# Altium schematic sheet Clock.SchDoc
size A4; SheetNumber: 10; SheetTotal: 11
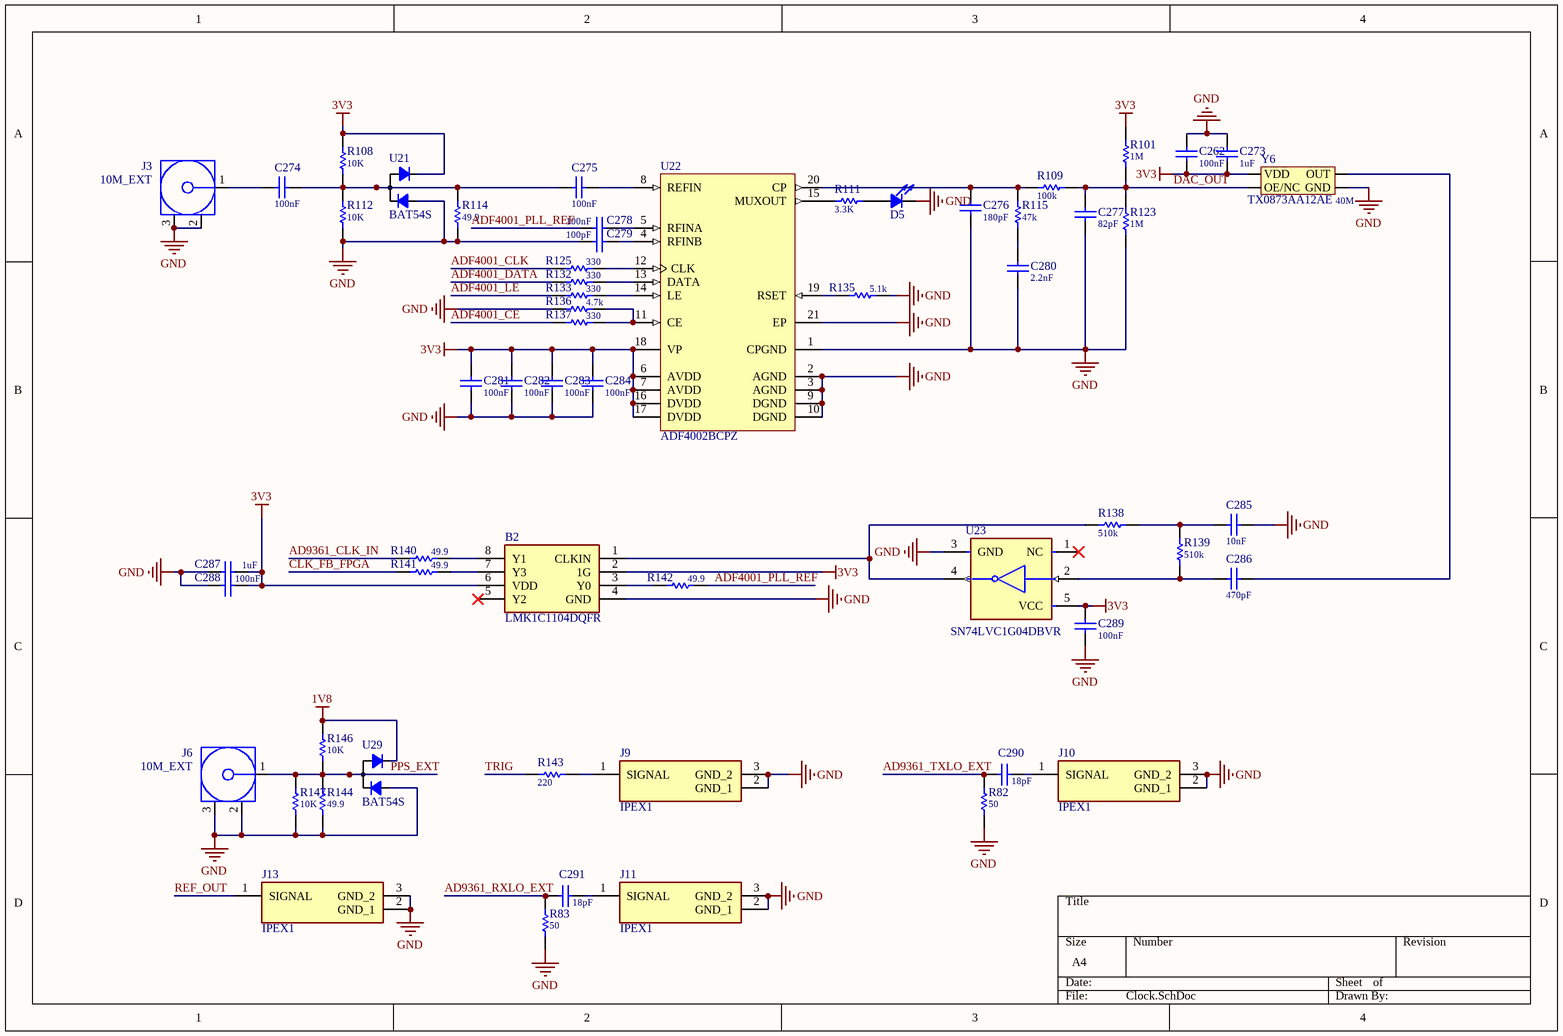
[diagram p0: Clock.SchDoc]

## Parts
B2  LMK1C1104DQFR  [SON50P200X200X80-8N]
C262  value 100nF  [C0402-L]  (hidden comment: Cap-S)
C273  value 1uF  [C0402-L]  (hidden comment: Cap-S)
C274  value 100nF  [C0402-L]  (hidden comment: Cap-S)
C275  value 100nF  [C0402-L]  (hidden comment: Cap-S)
C276  value 180pF  [C0402-L]  (hidden comment: Cap-S)
C277  value 82pF  [C0402-L]  (hidden comment: Cap-S)
C278  value 100nF  [C0402-L]  (hidden comment: Cap-S)
C279  value 100pF  [C0402-L]  (hidden comment: Cap-S)
C280  value 2.2nF  [C0402-L]  (hidden comment: Cap-S)
C281  value 100nF  [C0402-L]  (hidden comment: Cap-S)
C282  value 100nF  [C0402-L]  (hidden comment: Cap-S)
C283  value 100nF  [C0402-L]  (hidden comment: Cap-S)
C284  value 100nF  [C0402-L]  (hidden comment: Cap-S)
C285  value 10nF  [C0402-L]  (hidden comment: Cap-S)
C286  value 470pF  [C0402-L]  (hidden comment: Cap-S)
C287  value 1uF  [C0402-L]  (hidden comment: Cap-S)
C288  value 100nF  [C0402-L]  (hidden comment: Cap-S)
C289  value 100nF  [C0402-L]  (hidden comment: Cap-S)
C290  value 18pF  [C0402-L]  (hidden comment: Cap-S)
C291  value 18pF  [C0402-L]  (hidden comment: Cap-S)
D5  LED  [LED_0603_L]  (value not drawn)
J3  10M_EXT  [66012202111305]
J6  10M_EXT  [66012202111305]
J9  IPEX1  [20279-001E]
J10  IPEX1  [20279-001E]
J11  IPEX1  [20279-001E]
J13  IPEX1  [20279-001E]
R82  value 50  [R0402-L]  (hidden comment: R)
R83  value 50  [R0402-L]  (hidden comment: R)
R101  value 1M  [R0402-L]  (hidden comment: R)
R108  value 10K  [R0402-L]  (hidden comment: R)
R109  value 100k  [R0402-L]  (hidden comment: R)
R111  value 3.3K  [R0402-L]  (hidden comment: R)
R112  value 10K  [R0402-L]  (hidden comment: R)
R114  value 49.9  [R0402-L]  (hidden comment: R)
R115  value 47k  [R0402-L]  (hidden comment: R)
R123  value 1M  [R0402-L]  (hidden comment: R)
R125  value 330  [R0402-L]  (hidden comment: R)
R132  value 330  [R0402-L]  (hidden comment: R)
R133  value 330  [R0402-L]  (hidden comment: R)
R135  value 5.1k  [R0402-L]  (hidden comment: R)
R136  value 4.7k  [R0402-L]  (hidden comment: R)
R137  value 330  [R0402-L]  (hidden comment: R)
R138  value 510k  [R0402-L]  (hidden comment: R)
R139  value 510k  [R0402-L]  (hidden comment: R)
R140  value 49.9  [R0402-L]  (hidden comment: R)
R141  value 49.9  [R0402-L]  (hidden comment: R)
R142  value 49.9  [R0402-L]  (hidden comment: R)
R143  value 220  [R0402-L]  (hidden comment: R)
R144  value 49.9  [R0402-L]  (hidden comment: R)
R146  value 10K  [R0402-L]  (hidden comment: R)
R147  value 10K  [R0402-L]  (hidden comment: R)
U21  BAT54S  [SOT-23-3]
U22  ADF4002BCPZ  [ADI-CP-20-1_N]
U23  SN74LVC1G04DBVR  [FP-DBV0005A-IPC_C]
U29  BAT54S  [SOT-23-3]
Y6  TX0873AA12AE  value 40M  [XTAL-2520]

## Nets
1V8: R146.1 U29.3
3V3: B2.2(1G) B2.6(VDD) C262.1 C273.1 C281.2 C282.2 C283.2 C284.2 C287.1 C288.1 C289.1 R101.1 R108.1 U21.3 U22.6(AVDD) U22.7(AVDD) U22.16(DVDD) U22.17(DVDD) U22.18(VP) U23.5(VCC) Y6.4(VDD)
GND: B2.4(GND) C262.2 C273.2 C276.1 C277.1 C279.1 C280.1 C281.1 C282.1 C283.1 C284.1 C285.1 C287.2 C288.2 C289.2 D5.2 J3.2(GND) J3.3(GND) J6.2(GND) J6.3(GND) J9.2(GND_1) J9.3(GND_2) J10.2(GND_1) J10.3(GND_2) J11.2(GND_1) J11.3(GND_2) J13.2(GND_1) J13.3(GND_2) R82.2 R83.2 R112.2 R114.2 R123.2 R135.2 R136.1 R144.1 R147.2 U21.1 U22.1(CPGND) U22.2(AGND) U22.3(AGND) U22.9(DGND) U22.10(DGND) U22.21(EP) U23.3(GND) U29.1 Y6.2(GND)
AD9361_CLK_IN: R140.1
AD9361_RXLO_EXT: C291.2 R83.1
AD9361_TXLO_EXT: C290.2 R82.1
ADF4001_CE: R137.1
ADF4001_CLK: R125.1
ADF4001_DATA: R132.1
ADF4001_LE: R133.1
ADF4001_PLL_REF: C278.1 R142.2
CLK_FB_FPGA: R141.1
DAC_OUT: C277.2 R101.2 R109.1 R123.1 Y6.1(OE/NC)
PPS_EXT: J6.1(Signal) R144.2 R146.2 R147.1 U29.2
REF_OUT: J13.1(SIGNAL)
TRIG: R143.2
NetB2_1: B2.1(CLKIN) R138.2 U23.4(Y)
NetB2_3: B2.3(Y0) R142.1
NetB2_7: B2.7(Y3) R141.2
NetB2_8: B2.8(Y1) R140.2
NetC274_1: C274.1 J3.1(Signal)
NetC274_2: C274.2 C275.1 R108.2 R112.1 R114.1 U21.2
NetC275_2: C275.2 U22.8(REFIN)
NetC276_2: C276.2 R109.2 R115.2 U22.20(CP)
NetC278_2: C278.2 U22.5(RFINA)
NetC279_2: C279.2 U22.4(RFINB)
NetC280_2: C280.2 R115.1
NetC285_2: C285.2 R138.1 R139.1
NetC286_1: C286.1 Y6.3(OUT)
NetC286_2: C286.2 R139.2 U23.2(A)
NetC290_1: C290.1 J10.1(SIGNAL)
NetC291_1: C291.1 J11.1(SIGNAL)
NetD5_1: D5.1 R111.2
NetJ9_1: J9.1(SIGNAL) R143.1
NetR111_1: R111.1 U22.15(MUXOUT)
NetR125_2: R125.2 U22.12(CLK)
NetR132_2: R132.2 U22.13(DATA)
NetR133_2: R133.2 U22.14(LE)
NetR135_1: R135.1 U22.19(RSET)
NetR136_2: R136.2 R137.2 U22.11(CE)

Not connected (* = marked no-connect by the designer): B2 5(Y2)*; U23 1(NC)*

## Library data of the parts
B2 = LMK1C1104DQFR: Clock Buffer 4-channel output LVC MOS 1.8-V buffer; Manufacturer_Name: Texas Instruments; Geometry.Height: 0.8mm; Manufacturer_Part_Number: LMK1C1104DQFR; Mouser Part Number: 595-LMK1C1104DQFR; Mouser Price/Stock: https://www.mouser.co.uk/ProductDetail/Texas-Instruments/LMK1C1104DQFR?qs=QNEnbhJQKvYdwt0bSAj%252Blw%3D%3D; Arrow Part Number: LMK1C1104DQFR; Arrow Price/Stock: https://www.arrow.com/en/products/lmk1c1104dqfr/texas-instruments?utm_currency=USD&region=nac; Datasheet Link: https://www.ti.com/lit/ds/symlink/lmk1c1104.pdf?ts=1625794058723&ref_url=https%253A%252F%252Fwww.ti.com%252Fproduct%252FLMK1C1104
C262 C273-C291 = Cap-S: 贴片瓷片电容
D5 = LED: 发光二极管
J3 J6 = CMP-03913-103227005-2: Rf Coaxial, Mmcx Jack, 50 Ohm, Pcb Rohs Compliant: Yes; Impedance: 50Ω; Insertion Loss (dB): 0.25dB; Insulation Resistance: 1GΩ; Insulation Material: PTFE; Min Operating Temperature: -55°C; Packaging: Tape and Reel; Connector Type: MMCX; Max Operating Temperature: 155°C
J9-J11 J13 = IPEX4
R82 R83 R101 R108 R109 R111 R112 R114 R115 R123 R125 R132 R133 R135-R144 R146 R147 = Res: 贴片电阻
U22 = CMP-0287-00009-1: 200 MHz Clock Generator PLL, CP-20-1, Pb-Free, 490 Tray; Norm Phase Noise (dBc/Hz): -217dBc; Single/Dual: Single; Max REFin (MHz): 104MHz; Max RF Input (MHz): 200MHz; Frequency Range: 10MHz-200MHz; Supply Current: 4.5mA; ComponentLink2Description: Datasheet; PackageDescription: 20-Lead Lead Frame Chip Scale Package [LFCSP_VQ]; ComponentLink3Description: Package Specification; ComponentLink3URL: http://www.analog.com/static/imported-files/packages/PKG_PDF/LFCSP(CP)/CP_20_1.pdf; DatasheetVersion: REV. A; Code_JEDEC: MO-220-VGGD-1; PackageVersion: 012508-B; ComponentLink1Description: Manufacturer URL; ComponentLink1URL: www.analog.com; PackageReference: CP-20-1; ComponentLink2URL: http://www.analog.com/static/imported-files/data_sheets/ADF4001.pdf
U23 = CMP-04903-000078-1: IC INVERTER 1CH 1-INP SOT23-5; Logic Function: Buffer; Number of Bits: 1; Voltage Rating (AC): 250V; Min Supply Voltage: 1.65V; Capacitance: 22nF; Propagation Delay: 3.7ns; Tolerance: 5%; High Level Output Current: -32mA; Turn-On Delay Time: 7.5ns; Voltage Rating (DC): 400V; Output Current: 32mA; Dielectric Material: PP; Quiescent Current: 10uA; Max Supply Voltage: 5.5V; REACH SVHC: No SVHC; Case/Package: SOT-23-5; Number of Pins: 5; Min Operating Temperature: -40°C; Technology: CMOS; Number of Inputs: 1; Weight: 0.000557oz; Radiation Hardening: No; Packaging: Tape and Reel; RoHS Compliant: Yes; Package Quantity: 3000; Number of Gates: 1; Lead Free: Lead Free; Termination: PC Pins; Mount: Surface Mount; Series: 74LVC; Number of Elements: 1; Number of Circuits: 1; Max Operating Temperature: 125°C; Low Level Output Current: 32mA
Y6 = XTALS: 贴片有源晶振